# Altium schematic sheet mini.SchDoc
size A4
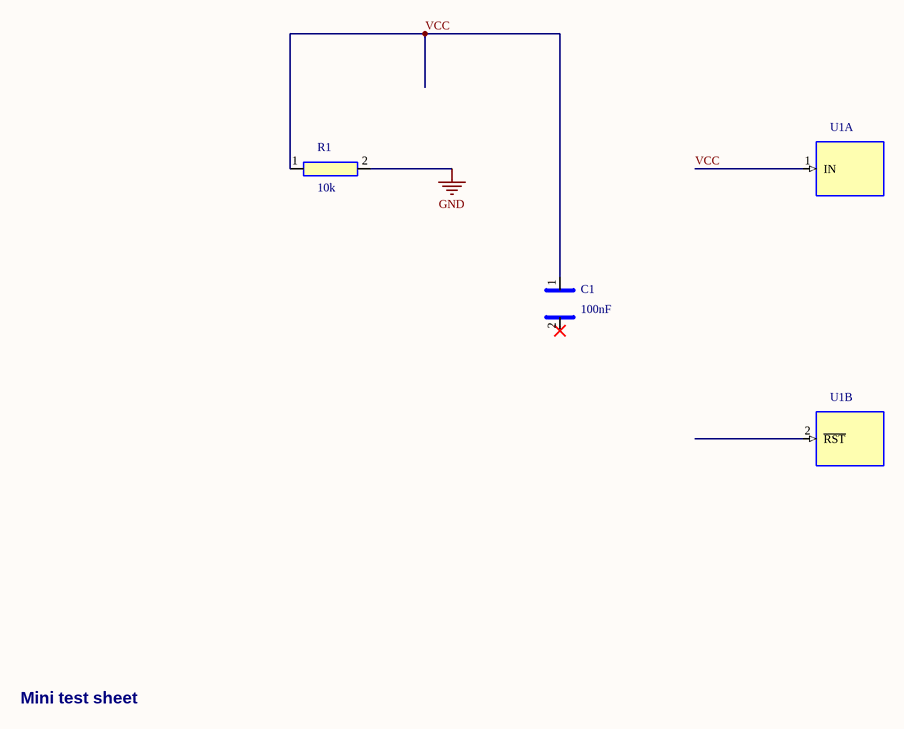
[diagram p0: mini.SchDoc]

## Parts
C1  100nF
R1  10k  [RES0805]
U1  (no value)  (parts A,B of 2)

## Nets
GND: R1.2
VCC: C1.1 R1.1 U1.1(IN)

Not connected (* = marked no-connect by the designer): C1 2*; U1 2(~{RST})

## Notes on the sheet
- Mini test sheet

## Library data of the parts
C1 = CAP: Capacitor; Value: 100nF
R1 = RES: Resistor
U1 = DUAL: Dual gate